# Altium project ELO301_G1.PrjPcb
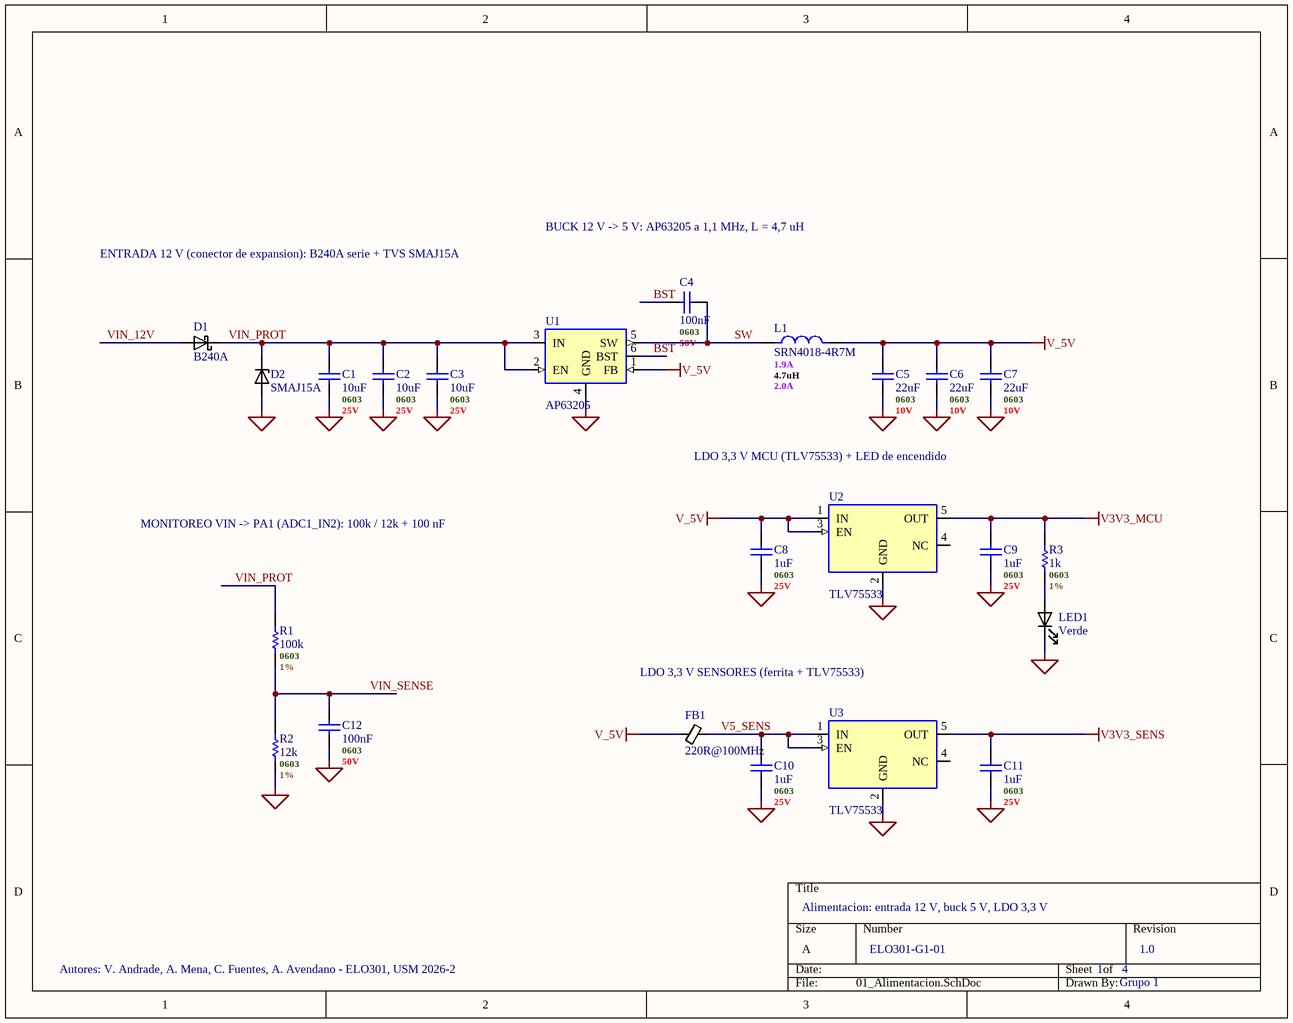
[diagram p0: 01_Alimentacion.SchDoc]
4 sheets, 70 parts. Net scope: global (net labels, ports and power ports of the same name join across sheets).
Board file: ELO301_G1.PcbDoc
Sheets:
  01_Alimentacion.SchDoc
  02_MCU.SchDoc
  03_Sensores.SchDoc
  04_Conectores.SchDoc

## Sheet 01_Alimentacion.SchDoc
size A; SheetNumber: 1; SheetTotal: 4

### Parts
C1  10uF  .Case/Package: 0603  .Voltage Rating (DC): 25V  [C0603 - MURATA]
C2  10uF  .Case/Package: 0603  .Voltage Rating (DC): 25V  [C0603 - MURATA]
C3  10uF  .Case/Package: 0603  .Voltage Rating (DC): 25V  [C0603 - MURATA]
C4  100nF  .Case/Package: 0603  .Voltage Rating (DC): 50V  [C0603 - MURATA]
C5  22uF  .Case/Package: 0603  .Voltage Rating (DC): 10V  [C0603 - MURATA]
C6  22uF  .Case/Package: 0603  .Voltage Rating (DC): 10V  [C0603 - MURATA]
C7  22uF  .Case/Package: 0603  .Voltage Rating (DC): 10V  [C0603 - MURATA]
C8  1uF  .Case/Package: 0603  .Voltage Rating (DC): 25V  [C0603 - MURATA]
C9  1uF  .Case/Package: 0603  .Voltage Rating (DC): 25V  [C0603 - MURATA]
C10  1uF  .Case/Package: 0603  .Voltage Rating (DC): 25V  [C0603 - MURATA]
C11  1uF  .Case/Package: 0603  .Voltage Rating (DC): 25V  [C0603 - MURATA]
C12  100nF  .Case/Package: 0603  .Voltage Rating (DC): 50V  [C0603 - MURATA]
D1  B240A  [SMA - DIODES]
D2  SMAJ15A  [SMA - DIODES]
FB1  220R@100MHz  [L0603 - GENERIC]
L1  SRN4018-4R7M  .RMS Current (Irms): 1.9A  .Value: 4.7uH  .Max DC Current: 2.0A  [SRN4018 - BOURNS]
LED1  Verde  [LED0603 - LITEON]
R1  100k  .Case/Package: 0603  .Tolerance: 1%  [R0603 - YAGEO]
R2  12k  .Case/Package: 0603  .Tolerance: 1%  [R0603 - YAGEO]
R3  1k  .Case/Package: 0603  .Tolerance: 1%  [R0603 - YAGEO]
U1  AP63205  [TSOT-23-6 - DIODES]
U2  TLV75533  [SOT-23-5 - TI]
U3  TLV75533  [SOT-23-5 - TI]

### Nets
GND: C1.2 C2.2 C3.2 C5.2 C6.2 C7.2 C8.2 C9.2 C10.2 C11.2 C12.2 D2.2(A) LED1.1(K) R2.1 U1.4(GND) U2.2(GND) U3.2(GND)
V3V3_MCU: C9.1 R3.2 U2.5(OUT)
V3V3_SENS: C11.1 U3.5(OUT)
V_5V: C5.1 C6.1 C7.1 C8.1 FB1.1 L1.2 U1.1(FB) U2.1(IN) U2.3(EN)
BST: C4.1 U1.6(BST)
SW: C4.2 L1.1 U1.5(SW)
V5_SENS: C10.1 FB1.2 U3.1(IN) U3.3(EN)
VIN_12V: D1.2(A)
VIN_PROT: C1.1 C2.1 C3.1 D1.1(K) D2.1(K) R1.2 U1.2(EN) U1.3(IN)
VIN_SENSE: C12.1 R1.1 R2.2
NetLED1_2: LED1.2(A) R3.1

Not connected (* = marked no-connect by the designer): U2 4(NC); U3 4(NC)

### Notes on the sheet
- BUCK 12 V -> 5 V: AP63205 a 1,1 MHz, L = 4,7 uH
- ENTRADA 12 V (conector de expansion): B240A serie + TVS SMAJ15A
- LDO 3,3 V MCU (TLV75533) + LED de encendido
- MONITOREO VIN -> PA1 (ADC1_IN2): 100k / 12k + 100 nF
- LDO 3,3 V SENSORES (ferrita + TLV75533)
- Alimentacion: entrada 12 V, buck 5 V, LDO 3,3 V
- Autores: V. Andrade, A. Mena, C. Fuentes, A. Avendano - ELO301, USM 2026-2
- ELO301-G1-01
- 1
- 4
- 1.0
- Grupo 1

### Library data of the parts
C1-C3 = CAP - GENERIC: 10 µF ±20% 25V Ceramic Capacitor X5R 0603 (1608 Metric); Manufacturer: Murata Electronics; Manufacturer Part Number: GRM188R61E106MA73D; Case/Package: 0603; Voltage Rating (DC): 25V; Supplier 1: DigiKey; Supplier Part Number 1: 490-7202-1-ND; Supplier 2: LCSC; Supplier Part Number 2: C91606; Category: Ceramic Capacitors; Operating Temperature: -55°C ~ 85°C; Lifecycle Status: Active; ComponentLink1Description: Datasheet; ComponentLink1URL: https://mm.digikey.com/Volume0/opasdata/d220001/medias/docus/8942/Chip_Multilayer_CAT2021_MLCC.pdf; ComponentLink2Description: DigiKey; ComponentLink2URL: https://www.digikey.com/en/products/result?keywords=GRM188R61E106MA73D
C4 C12 = CAP - GENERIC: 0.1 µF ±10% 50V Ceramic Capacitor X7R 0603 (1608 Metric); Manufacturer: Murata Electronics; Manufacturer Part Number: GCM188R71H104KA57D; Case/Package: 0603; Voltage Rating (DC): 50V; Supplier 1: DigiKey; Supplier Part Number 1: 490-4779-1-ND; Category: Ceramic Capacitors; Operating Temperature: -55°C ~ 125°C; Lifecycle Status: Active; ComponentLink1Description: Datasheet; ComponentLink1URL: https://pim.murata.com/asset/pim4/ceramicCapacitorSMD/GCM188R71H104KA57-01A-EN_PDF_CERAMICCAPACITORSMD; ComponentLink2Description: DigiKey; ComponentLink2URL: https://www.digikey.com/en/products/result?keywords=GCM188R71H104KA57D
C5-C7 = CAP - GENERIC: 22 µF ±20% 10V Ceramic Capacitor X5R 0603 (1608 Metric); Manufacturer: Murata Electronics; Manufacturer Part Number: GRM188R61A226ME15D; Case/Package: 0603; Voltage Rating (DC): 10V; Supplier 1: DigiKey; Supplier Part Number 1: 490-10476-1-ND; Supplier 2: LCSC; Supplier Part Number 2: C84419; Category: Ceramic Capacitors; Operating Temperature: -55°C ~ 85°C; Lifecycle Status: Active; ComponentLink1Description: Datasheet; ComponentLink1URL: https://mm.digikey.com/Volume0/opasdata/d220001/medias/docus/8942/490_Chip_Multilayer_CAT2021_MLCC.pdf; ComponentLink2Description: DigiKey; ComponentLink2URL: https://www.digikey.com/en/products/result?keywords=GRM188R61A226ME15D
C8-C11 = CAP - GENERIC: 1 µF ±10% 25V Ceramic Capacitor X7R 0603 (1608 Metric); Manufacturer: Murata Electronics; Manufacturer Part Number: GCM188R71E105KA64D; Case/Package: 0603; Voltage Rating (DC): 25V; Supplier 1: DigiKey; Supplier Part Number 1: 490-10673-1-ND; Category: Ceramic Capacitors; Operating Temperature: -55°C ~ 125°C; Lifecycle Status: Active; ComponentLink1Description: Datasheet; ComponentLink1URL: https://pim.murata.com/asset/pim4/ceramicCapacitorSMD/GCM188R71E105KA64-04A-EN_PDF_CERAMICCAPACITORSMD; ComponentLink2Description: DigiKey; ComponentLink2URL: https://www.digikey.com/en/products/result?keywords=GCM188R71E105KA64D
D1 = B240A-13-F: Schottky Diode 40 V 2A Surface Mount SMA; Manufacturer: Diodes Incorporated; Manufacturer Part Number: B240A-13-F; Supplier 1: DigiKey; Supplier Part Number 1: B240A-FDICT-ND; Supplier 2: LCSC; Supplier Part Number 2: C92506; Category: Single Diodes; Case/Package: DO-214AC, SMA; Supplier Device Package: SMA; Operating Temperature: -65°C ~ 150°C; Lifecycle Status: Active; ComponentLink1Description: Datasheet; ComponentLink1URL: https://www.diodes.com/assets/Datasheets/B220_A-B260_A.pdf; ComponentLink2Description: DigiKey; ComponentLink2URL: https://www.digikey.com/en/products/result?keywords=B240A-13-F
D2 = SMAJ15A-13-F: 24.4V Clamp 16.4A Ipp Tvs Diode Surface Mount SMA; Manufacturer: Diodes Incorporated; Manufacturer Part Number: SMAJ15A-13-F; Supplier 1: DigiKey; Supplier Part Number 1: SMAJ15A-FDICT-ND; Supplier 2: LCSC; Supplier Part Number 2: C110520; Category: TVS Diodes; Case/Package: DO-214AC, SMA; Supplier Device Package: SMA; Operating Temperature: -55°C ~ 150°C (TJ); Lifecycle Status: Active; ComponentLink1Description: Datasheet; ComponentLink1URL: https://www.diodes.com/assets/Datasheets/SMAJ5.0CA-SMAJ200CA.pdf; ComponentLink2Description: DigiKey; ComponentLink2URL: https://www.digikey.com/en/products/result?keywords=SMAJ15A-13-F
FB1 = FERRITE - GENERIC: 220 Ohms @ 100 MHz 1 Power Line Ferrite Bead 0603 (1608 Metric) 1.4A 100mOhm; Manufacturer: Murata Electronics; Manufacturer Part Number: BLM18PG221SN1D; Supplier 1: DigiKey; Supplier Part Number 1: 490-5221-1-ND; Supplier 2: LCSC; Supplier Part Number 2: C80165; Category: Ferrite Beads and Chips; Case/Package: 0603 (1608 Metric); Operating Temperature: -55°C ~ 125°C; Lifecycle Status: Active; ComponentLink1Description: Datasheet; ComponentLink1URL: https://pim.murata.com/asset/pim4/ferriteBeadInductortypefilter/ENFA0003_PDF_FERRITEBEADINDUCTORTYPEFILTER; ComponentLink2Description: DigiKey; ComponentLink2URL: https://www.digikey.com/en/products/result?keywords=BLM18PG221SN1D
L1 = INDUCTOR - GENERIC: 4.7 µH Shielded Drum Core, Wirewound Inductor 1.9 A 84mOhm Max Nonstandard; Manufacturer: Bourns Inc.; Value: 4.7uH; Manufacturer Part Number: SRN4018-4R7M; RMS Current (Irms): 1.9A; Max DC Current: 2.0A; Supplier 1: DigiKey; Supplier Part Number 1: SRN4018-4R7MCT-ND; Supplier 2: LCSC; Supplier Part Number 2: C780206; Category: Fixed Inductors; Operating Temperature: -40°C ~ 125°C; Lifecycle Status: Active; ComponentLink1Description: Datasheet; ComponentLink1URL: https://www.bourns.com/docs/Product-Datasheets/SRN4018.pdf; ComponentLink2Description: DigiKey; ComponentLink2URL: https://www.digikey.com/en/products/result?keywords=SRN4018-4R7M
LED1 = LED - GENERIC: Green 571nm LED Indication - Discrete 2V 0603 (1608 Metric); Manufacturer: Lite-On Inc.; Manufacturer Part Number: LTST-C191KGKT; Supplier 1: DigiKey; Supplier Part Number 1: 160-1446-1-ND; Supplier 2: LCSC; Supplier Part Number 2: C125098; Category: LED Indication - Discrete; Case/Package: 0603 (1608 Metric); Lifecycle Status: Active; ComponentLink1Description: Datasheet; ComponentLink1URL: https://optoelectronics.liteon.com/upload/download/DS22-2000-228/LTST-C191KGKT.PDF; ComponentLink2Description: DigiKey; ComponentLink2URL: https://www.digikey.com/en/products/result?keywords=LTST-C191KGKT
R1 = RESISTOR - GENERIC: 100 kOhms ±1% 0.1W, 1/10W Chip Resistor 0603 (1608 Metric) Moisture Resistant Thick Film; Manufacturer: YAGEO; Manufacturer Part Number: RC0603FR-07100KL; Case/Package: 0603; Tolerance: 1%; Supplier 1: DigiKey; Supplier Part Number 1: 311-100KHRCT-ND; Supplier 2: LCSC; Supplier Part Number 2: C14675; Category: Chip Resistor - Surface Mount; Operating Temperature: -55°C ~ 155°C; Lifecycle Status: Active; ComponentLink1Description: Datasheet; ComponentLink1URL: https://yageogroup.com/content/datasheet/asset/file/PYU-RC_GROUP_51_ROHS_L; ComponentLink2Description: DigiKey; ComponentLink2URL: https://www.digikey.com/en/products/result?keywords=RC0603FR-07100KL
R2 = RESISTOR - GENERIC: 12 kOhms ±1% 0.1W, 1/10W Chip Resistor 0603 (1608 Metric) Moisture Resistant Thick Film; Manufacturer: YAGEO; Manufacturer Part Number: RC0603FR-0712KL; Case/Package: 0603; Tolerance: 1%; Supplier 1: DigiKey; Supplier Part Number 1: 311-12.0KHRCT-ND; Supplier 2: LCSC; Supplier Part Number 2: C114659; Category: Chip Resistor - Surface Mount; Operating Temperature: -55°C ~ 155°C; Lifecycle Status: Active; ComponentLink1Description: Datasheet; ComponentLink1URL: https://yageogroup.com/content/datasheet/asset/file/PYU-RC_GROUP_51_ROHS_L; ComponentLink2Description: DigiKey; ComponentLink2URL: https://www.digikey.com/en/products/result?keywords=RC0603FR-0712KL
R3 = RESISTOR - GENERIC: 1 kOhms ±1% 0.1W, 1/10W Chip Resistor 0603 (1608 Metric) Moisture Resistant Thick Film; Manufacturer: YAGEO; Manufacturer Part Number: RC0603FR-071KL; Case/Package: 0603; Tolerance: 1%; Supplier 1: DigiKey; Supplier Part Number 1: 311-1.00KHRCT-ND; Supplier 2: LCSC; Supplier Part Number 2: C22548; Category: Chip Resistor - Surface Mount; Operating Temperature: -55°C ~ 155°C; Lifecycle Status: Active; ComponentLink1Description: Datasheet; ComponentLink1URL: https://yageogroup.com/content/datasheet/asset/file/PYU-RC_GROUP_51_ROHS_L; ComponentLink2Description: DigiKey; ComponentLink2URL: https://www.digikey.com/en/products/result?keywords=RC0603FR-071KL
U1 = AP63205WU-7: Buck Switching Regulator IC Positive Fixed 5V 1 Output 2A SOT-23-6 Thin, TSOT-23-6; Manufacturer: Diodes Incorporated; Manufacturer Part Number: AP63205WU-7; Supplier 1: DigiKey; Supplier Part Number 1: AP63205WU-7DICT-ND; Supplier 2: LCSC; Supplier Part Number 2: C2071056; Category: Voltage Regulators - DC DC Switching Regulators; Case/Package: SOT-23-6 Thin, TSOT-23-6; Supplier Device Package: TSOT-23-6; Operating Temperature: -40°C ~ 85°C (TA); Lifecycle Status: Active; ComponentLink1Description: Datasheet; ComponentLink1URL: https://www.diodes.com/assets/Datasheets/AP63200-AP63201-AP63203-AP63205.pdf; ComponentLink2Description: DigiKey; ComponentLink2URL: https://www.digikey.com/en/products/result?keywords=AP63205WU-7
U2 U3 = TLV75533PDBVR: Linear Voltage Regulator IC Positive Fixed 1 Output 500mA SOT-23-5; Manufacturer: Texas Instruments; Manufacturer Part Number: TLV75533PDBVR; Supplier 1: DigiKey; Supplier Part Number 1: 296-50411-1-ND; Supplier 2: LCSC; Supplier Part Number 2: C404027; Category: Voltage Regulators - Linear, Low Drop Out (LDO) Regulators; Case/Package: SC-74A, SOT-753; Supplier Device Package: SOT-23-5; Operating Temperature: -40°C ~ 125°C (TJ); Lifecycle Status: Active; ComponentLink1Description: Datasheet; ComponentLink1URL: https://www.ti.com/lit/ds/symlink/tlv755p.pdf; ComponentLink2Description: DigiKey; ComponentLink2URL: https://www.digikey.com/en/products/result?keywords=TLV75533PDBVR

## Sheet 02_MCU.SchDoc
size A; SheetNumber: 2; SheetTotal: 4
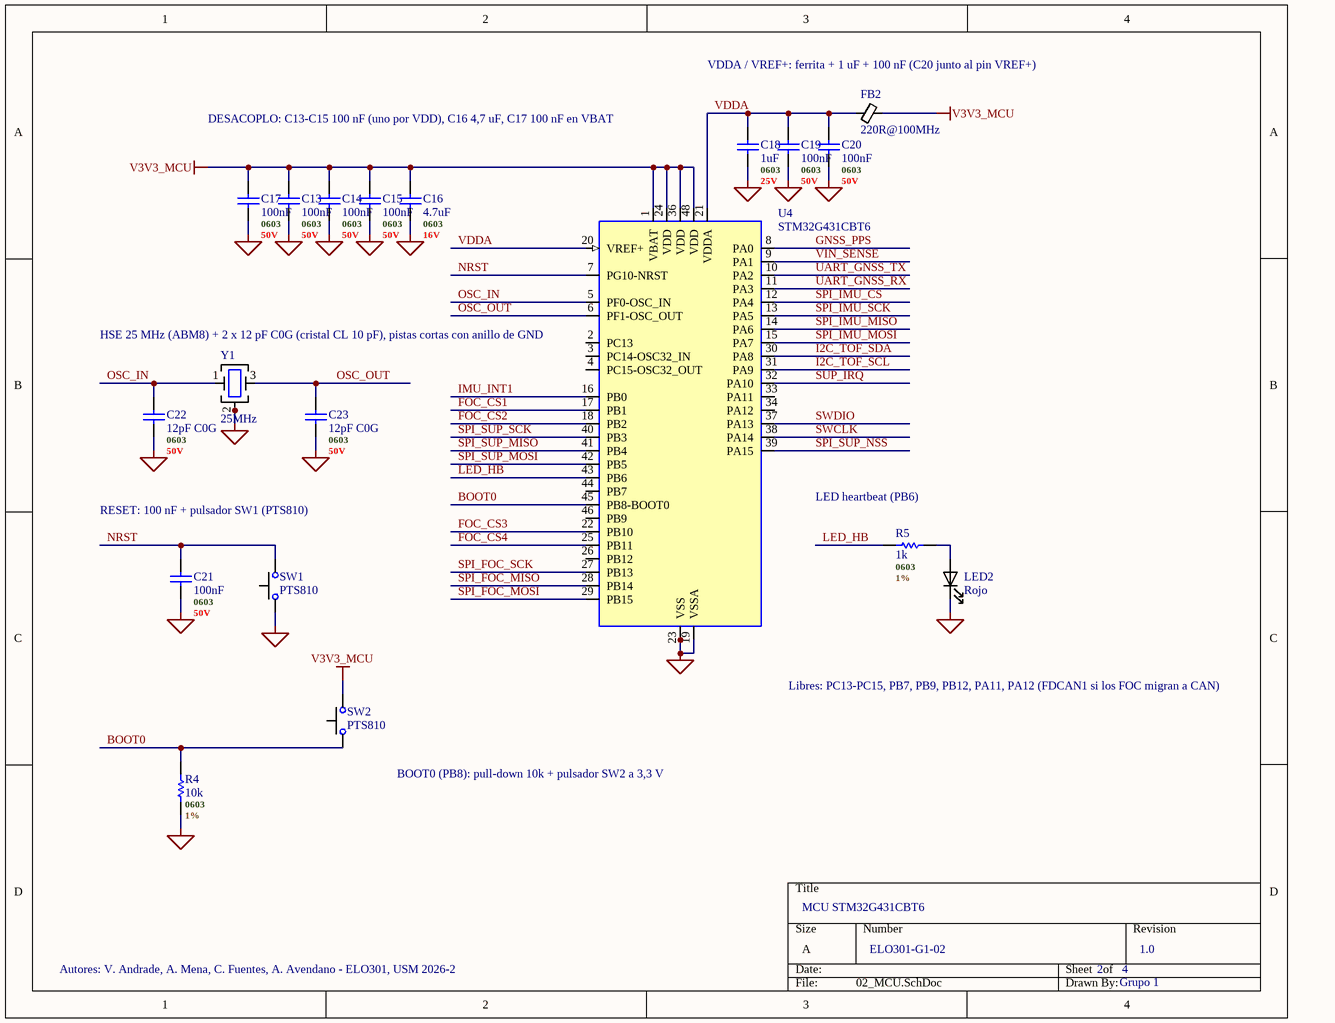
[diagram p1: 02_MCU.SchDoc]

### Parts
C13  100nF  .Case/Package: 0603  .Voltage Rating (DC): 50V  [C0603 - MURATA]
C14  100nF  .Case/Package: 0603  .Voltage Rating (DC): 50V  [C0603 - MURATA]
C15  100nF  .Case/Package: 0603  .Voltage Rating (DC): 50V  [C0603 - MURATA]
C16  4.7uF  .Case/Package: 0603  .Voltage Rating (DC): 16V  [C0603 - MURATA]
C17  100nF  .Case/Package: 0603  .Voltage Rating (DC): 50V  [C0603 - MURATA]
C18  1uF  .Case/Package: 0603  .Voltage Rating (DC): 25V  [C0603 - MURATA]
C19  100nF  .Case/Package: 0603  .Voltage Rating (DC): 50V  [C0603 - MURATA]
C20  100nF  .Case/Package: 0603  .Voltage Rating (DC): 50V  [C0603 - MURATA]
C21  100nF  .Case/Package: 0603  .Voltage Rating (DC): 50V  [C0603 - MURATA]
C22  12pF C0G  .Case/Package: 0603  .Voltage Rating (DC): 50V  [C0603 - MURATA]
C23  12pF C0G  .Case/Package: 0603  .Voltage Rating (DC): 50V  [C0603 - MURATA]
FB2  220R@100MHz  [L0603 - GENERIC]
LED2  Rojo  [LED0603 - LITEON]
R4  10k  .Case/Package: 0603  .Tolerance: 1%  [R0603 - YAGEO]
R5  1k  .Case/Package: 0603  .Tolerance: 1%  [R0603 - YAGEO]
SW1  PTS810  [PTS810 - CK]
SW2  PTS810  [PTS810 - CK]
U4  STM32G431CBT6  [LQFP-48 - ST]
Y1  25MHz  [ABM8 - ABRACON]

### Nets
GND: C13.2 C14.2 C15.2 C16.2 C17.2 C18.2 C19.2 C20.2 C21.2 C22.2 C23.2 LED2.1(K) R4.1 SW1.1 U4.19(VSSA) U4.23(VSS) U4.35(VSS) U4.47(VSS) Y1.2(G) Y1.4(G)
V3V3_MCU: C13.1 C14.1 C15.1 C16.1 C17.1 FB2.2 SW2.2 U4.1(VBAT) U4.24(VDD) U4.36(VDD) U4.48(VDD)
BOOT0: R4.2 SW2.1 U4.45(PB8-BOOT0)
FOC_CS1: U4.17(PB1)
FOC_CS2: U4.18(PB2)
FOC_CS3: U4.22(PB10)
FOC_CS4: U4.25(PB11)
GNSS_PPS: U4.8(PA0)
I2C_TOF_SCL: U4.31(PA9)
I2C_TOF_SDA: U4.30(PA8)
IMU_INT1: U4.16(PB0)
LED_HB: R5.1 U4.43(PB6)
NRST: C21.1 SW1.2 U4.7(PG10-NRST)
OSC_IN: C22.1 U4.5(PF0-OSC_IN) Y1.1
OSC_OUT: C23.1 U4.6(PF1-OSC_OUT) Y1.3
SPI_FOC_MISO: U4.28(PB14)
SPI_FOC_MOSI: U4.29(PB15)
SPI_FOC_SCK: U4.27(PB13)
SPI_IMU_CS: U4.12(PA4)
SPI_IMU_MISO: U4.14(PA6)
SPI_IMU_MOSI: U4.15(PA7)
SPI_IMU_SCK: U4.13(PA5)
SPI_SUP_MISO: U4.41(PB4)
SPI_SUP_MOSI: U4.42(PB5)
SPI_SUP_NSS: U4.39(PA15)
SPI_SUP_SCK: U4.40(PB3)
SUP_IRQ: U4.32(PA10)
SWCLK: U4.38(PA14)
SWDIO: U4.37(PA13)
UART_GNSS_RX: U4.11(PA3)
UART_GNSS_TX: U4.10(PA2)
VDDA: C18.1 C19.1 C20.1 FB2.1 U4.20(VREF+) U4.21(VDDA)
VIN_SENSE: U4.9(PA1)
NetLED2_2: LED2.2(A) R5.2

Not connected (* = marked no-connect by the designer): U4 2(PC13) 3(PC14-OSC32_IN) 4(PC15-OSC32_OUT) 26(PB12) 33(PA11) 34(PA12) 44(PB7) 46(PB9)

### Notes on the sheet
- (near FB2) VDDA / VREF+: ferrita + 1 uF + 100 nF (C20 junto al pin VREF+)
- DESACOPLO: C13-C15 100 nF (uno por VDD), C16 4,7 uF, C17 100 nF en VBAT
- (near U4) HSE 25 MHz (ABM8) + 2 x 12 pF C0G (cristal CL 10 pF), pistas cortas con anillo de GND
- LED heartbeat (PB6)
- RESET: 100 nF + pulsador SW1 (PTS810)
- Libres: PC13-PC15, PB7, PB9, PB12, PA11, PA12 (FDCAN1 si los FOC migran a CAN)
- BOOT0 (PB8): pull-down 10k + pulsador SW2 a 3,3 V
- MCU STM32G431CBT6
- Autores: V. Andrade, A. Mena, C. Fuentes, A. Avendano - ELO301, USM 2026-2
- ELO301-G1-02
- 2
- 4
- 1.0
- Grupo 1

### Library data of the parts
C13-C15 C17 C19-C21 = CAP - GENERIC: as C4 on sheet 01_Alimentacion; Case/Package: 0603; Voltage Rating (DC): 50V; Supplier 1: DigiKey; Supplier Part Number 1: 490-4779-1-ND; Category: Ceramic Capacitors; Operating Temperature: -55°C ~ 125°C; Lifecycle Status: Active; ComponentLink1Description: Datasheet; ComponentLink1URL: https://pim.murata.com/asset/pim4/ceramicCapacitorSMD/GCM188R71H104KA57-01A-EN_PDF_CERAMICCAPACITORSMD; ComponentLink2Description: DigiKey; ComponentLink2URL: https://www.digikey.com/en/products/result?keywords=GCM188R71H104KA57D
C16 = CAP - GENERIC: 4.7 µF ±20% 16V Ceramic Capacitor X5R 0603 (1608 Metric); Manufacturer: Murata Electronics; Manufacturer Part Number: GRM188R61C475ME11J; Case/Package: 0603; Voltage Rating (DC): 16V; Supplier 1: DigiKey; Supplier Part Number 1: 490-GRM188R61C475ME11JCT-ND; Category: Ceramic Capacitors; Operating Temperature: -55°C ~ 85°C; Lifecycle Status: Active; ComponentLink1Description: Datasheet; ComponentLink1URL: https://pim.murata.com/asset/pim4/ceramicCapacitorSMD/GRM188R61C475ME11-01A-EN_PDF_CERAMICCAPACITORSMD; ComponentLink2Description: DigiKey; ComponentLink2URL: https://www.digikey.com/en/products/result?keywords=GRM188R61C475ME11J
C18 = CAP - GENERIC: as C8 on sheet 01_Alimentacion; Case/Package: 0603; Voltage Rating (DC): 25V; Supplier 1: DigiKey; Supplier Part Number 1: 490-10673-1-ND; Category: Ceramic Capacitors; Operating Temperature: -55°C ~ 125°C; Lifecycle Status: Active; ComponentLink1Description: Datasheet; ComponentLink1URL: https://pim.murata.com/asset/pim4/ceramicCapacitorSMD/GCM188R71E105KA64-04A-EN_PDF_CERAMICCAPACITORSMD; ComponentLink2Description: DigiKey; ComponentLink2URL: https://www.digikey.com/en/products/result?keywords=GCM188R71E105KA64D
C22 C23 = CAP - GENERIC: 12 pF ±5% 50V Ceramic Capacitor C0G, NP0 0603 (1608 Metric); Manufacturer: Samsung Electro-Mechanics; Manufacturer Part Number: CL10C120JB8NNNC; Case/Package: 0603; Voltage Rating (DC): 50V; Supplier 1: DigiKey; Supplier Part Number 1: 1276-1254-1-ND; Supplier 2: LCSC; Supplier Part Number 2: C38523; Category: Ceramic Capacitors; Operating Temperature: -55°C ~ 125°C; Lifecycle Status: Active; ComponentLink1Description: Datasheet; ComponentLink1URL: https://mm.digikey.com/Volume0/opasdata/d220001/medias/docus/3682/CL10C120JB8NNNC_Spec.pdf; ComponentLink2Description: DigiKey; ComponentLink2URL: https://www.digikey.com/en/products/result?keywords=CL10C120JB8NNNC
FB2 = FERRITE - GENERIC: as FB1 on sheet 01_Alimentacion; Supplier 1: DigiKey; Supplier Part Number 1: 490-5221-1-ND; Supplier 2: LCSC; Supplier Part Number 2: C80165; Category: Ferrite Beads and Chips; Case/Package: 0603 (1608 Metric); Operating Temperature: -55°C ~ 125°C; Lifecycle Status: Active; ComponentLink1Description: Datasheet; ComponentLink1URL: https://pim.murata.com/asset/pim4/ferriteBeadInductortypefilter/ENFA0003_PDF_FERRITEBEADINDUCTORTYPEFILTER; ComponentLink2Description: DigiKey; ComponentLink2URL: https://www.digikey.com/en/products/result?keywords=BLM18PG221SN1D
LED2 = LED - GENERIC: Red 631nm LED Indication - Discrete 2V 0603 (1608 Metric); Manufacturer: Lite-On Inc.; Manufacturer Part Number: LTST-C191KRKT; Supplier 1: DigiKey; Supplier Part Number 1: 160-1447-1-ND; Supplier 2: LCSC; Supplier Part Number 2: C125099; Category: LED Indication - Discrete; Case/Package: 0603 (1608 Metric); Lifecycle Status: Active; ComponentLink1Description: Datasheet; ComponentLink1URL: https://optoelectronics.liteon.com/upload/download/DS22-2000-223/LTST-C191KRKT.PDF; ComponentLink2Description: DigiKey; ComponentLink2URL: https://www.digikey.com/en/products/result?keywords=LTST-C191KRKT
R4 = RESISTOR - GENERIC: 10 kOhms ±1% 0.1W, 1/10W Chip Resistor 0603 (1608 Metric) Moisture Resistant Thick Film; Manufacturer: YAGEO; Manufacturer Part Number: RC0603FR-0710KL; Case/Package: 0603; Tolerance: 1%; Supplier 1: DigiKey; Supplier Part Number 1: 311-10.0KHRCT-ND; Supplier 2: LCSC; Supplier Part Number 2: C98220; Category: Chip Resistor - Surface Mount; Operating Temperature: -55°C ~ 155°C; Lifecycle Status: Active; ComponentLink1Description: Datasheet; ComponentLink1URL: https://yageogroup.com/content/datasheet/asset/file/PYU-RC_GROUP_51_ROHS_L; ComponentLink2Description: DigiKey; ComponentLink2URL: https://www.digikey.com/en/products/result?keywords=RC0603FR-0710KL
R5 = RESISTOR - GENERIC: as R3 on sheet 01_Alimentacion; Case/Package: 0603; Tolerance: 1%; Supplier 1: DigiKey; Supplier Part Number 1: 311-1.00KHRCT-ND; Supplier 2: LCSC; Supplier Part Number 2: C22548; Category: Chip Resistor - Surface Mount; Operating Temperature: -55°C ~ 155°C; Lifecycle Status: Active; ComponentLink1Description: Datasheet; ComponentLink1URL: https://yageogroup.com/content/datasheet/asset/file/PYU-RC_GROUP_51_ROHS_L; ComponentLink2Description: DigiKey; ComponentLink2URL: https://www.digikey.com/en/products/result?keywords=RC0603FR-071KL
SW1 SW2 = PTS810 SJM 250 SMTR LFS: Tactile Switch SPST-NO Top Actuated Surface Mount; Manufacturer: C&K; Manufacturer Part Number: PTS810 SJM 250 SMTR LFS; Supplier 1: DigiKey; Supplier Part Number 1: CKN10502CT-ND; Supplier 2: LCSC; Supplier Part Number 2: C116501; Category: Tactile Switches; Case/Package: 4.20mm x 3.20mm; Operating Temperature: -40°C ~ 85°C; Lifecycle Status: Active; ComponentLink1Description: Datasheet; ComponentLink1URL: https://www.littelfuse.com/assetdocs/littelfuse-c-k-tactile-pts810-series-datasheet?assetguid=f1e4bc97-66e9-4beb-99c6-eaef0bd3bff4; ComponentLink2Description: DigiKey; ComponentLink2URL: https://www.digikey.com/en/products/result?keywords=PTS810%20SJM%20250%20SMTR%20LFS
U4 = STM32G431CBT6: ARM® Cortex®-M4F STM32G4 Microcontroller IC 32-Bit 170MHz 128KB (128K x 8) FLASH 48-LQFP (7x7); Manufacturer: STMicroelectronics; Manufacturer Part Number: STM32G431CBT6; Supplier 1: DigiKey; Supplier Part Number 1: 497-19473-ND; Supplier 2: LCSC; Supplier Part Number 2: C529355; Category: Microcontrollers; Case/Package: 48-LQFP; Supplier Device Package: 48-LQFP (7x7); Operating Temperature: -40°C ~ 85°C (TA); Lifecycle Status: Active; ComponentLink1Description: Datasheet; ComponentLink1URL: https://www.st.com/resource/en/datasheet/stm32g431cb.pdf; ComponentLink2Description: DigiKey; ComponentLink2URL: https://www.digikey.com/en/products/result?keywords=STM32G431CBT6
Y1 = ABM8-25.000MHZ-10-D1G-T: 25 MHz ±10ppm Crystal 10pF 50 Ohms 4-SMD, No Lead; Manufacturer: Abracon LLC; Manufacturer Part Number: ABM8-25.000MHZ-10-D1G-T; Supplier 1: DigiKey; Supplier Part Number 1: 535-13468-1-ND; Supplier 2: LCSC; Supplier Part Number 2: C5366868; Category: Crystals; Case/Package: 4-SMD, No Lead; Supplier Device Package: 4-SMD (3.2x2.5); Operating Temperature: -40°C ~ 85°C; Lifecycle Status: Active; ComponentLink1Description: Datasheet; ComponentLink1URL: https://mm.digikey.com/Volume0/opasdata/d220001/medias/docus/6536/ABM8_Datasheet.pdf; ComponentLink2Description: DigiKey; ComponentLink2URL: https://www.digikey.com/en/products/result?keywords=ABM8-25.000MHZ-10-D1G-T

## Sheet 03_Sensores.SchDoc
size A; SheetNumber: 3; SheetTotal: 4
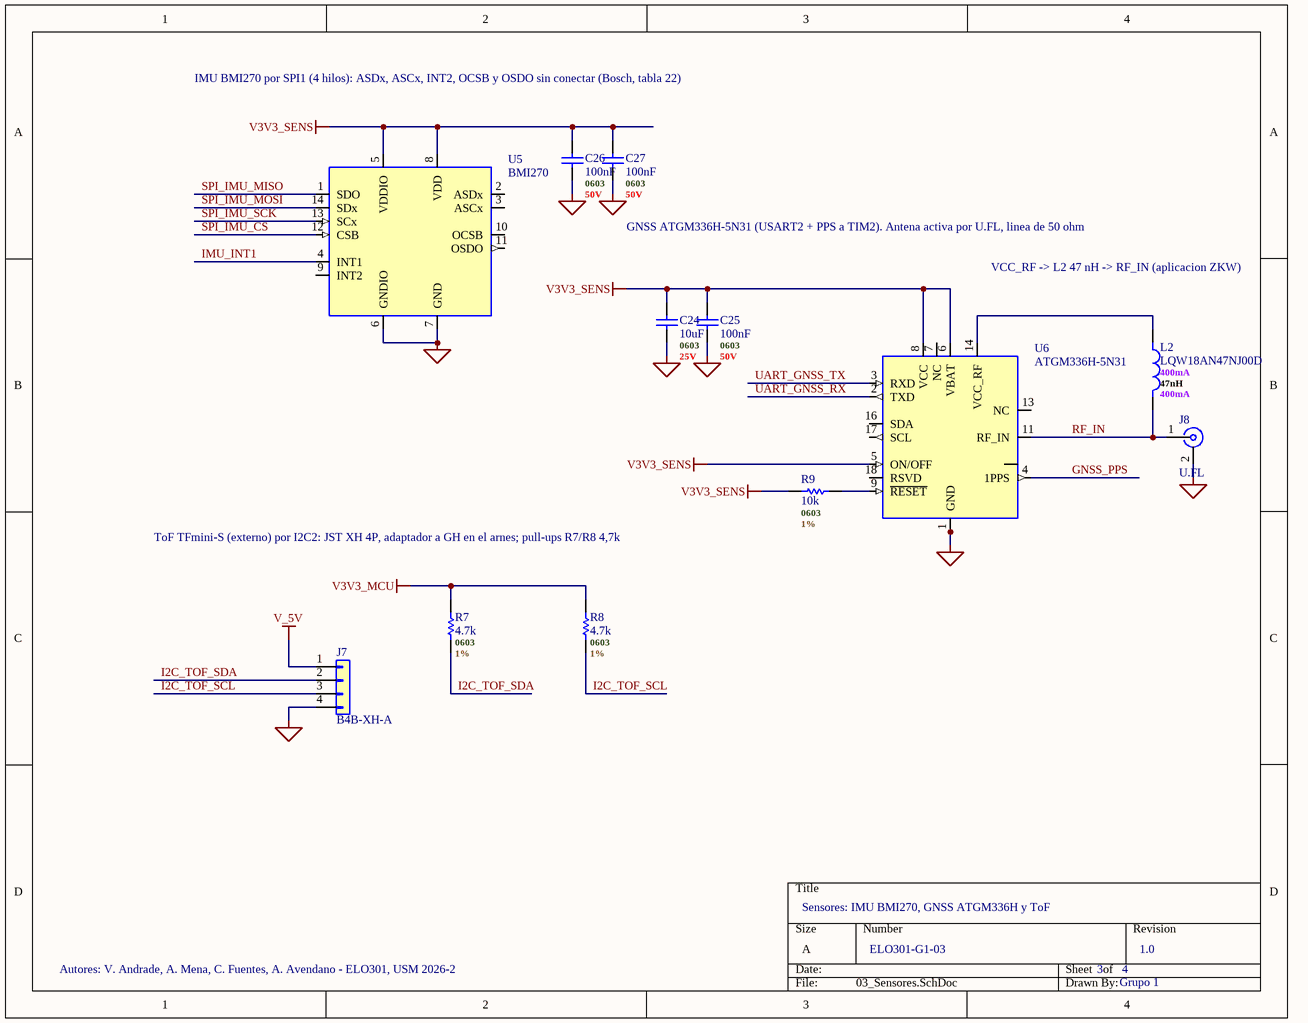
[diagram p2: 03_Sensores.SchDoc]

### Parts
C24  10uF  .Case/Package: 0603  .Voltage Rating (DC): 25V  [C0603 - MURATA]
C25  100nF  .Case/Package: 0603  .Voltage Rating (DC): 50V  [C0603 - MURATA]
C26  100nF  .Case/Package: 0603  .Voltage Rating (DC): 50V  [C0603 - MURATA]
C27  100nF  .Case/Package: 0603  .Voltage Rating (DC): 50V  [C0603 - MURATA]
J7  B4B-XH-A  [B4B-XH-A - JST]
J8  U.FL  [U.FL - HIROSE]
L2  LQW18AN47NJ00D  .RMS Current (Irms): 400mA  .Value: 47nH  [L0603 - GENERIC]
R7  4.7k  .Case/Package: 0603  .Tolerance: 1%  [R0603 - YAGEO]
R8  4.7k  .Case/Package: 0603  .Tolerance: 1%  [R0603 - YAGEO]
R9  10k  .Case/Package: 0603  .Tolerance: 1%  [R0603 - YAGEO]
U5  BMI270  [LGA-14 2.5x3.0 - BOSCH]
U6  ATGM336H-5N31  [LCC-18 9.7x10.1 - ZKW]

### Nets
GND: C24.2 C25.2 C26.2 C27.2 J7.4(Pin_4) J8.2(Ext) U5.6(GNDIO) U5.7(GND) U6.1(GND) U6.10(GND) U6.12(GND)
V3V3_MCU: R7.2 R8.2
V3V3_SENS: C24.1 C25.1 C26.1 C27.1 R9.1 U5.5(VDDIO) U5.8(VDD) U6.5(ON/OFF) U6.6(VBAT) U6.8(VCC)
V_5V: J7.1(Pin_1)
GNSS_PPS: U6.4(1PPS)
I2C_TOF_SCL: J7.3(Pin_3) R8.1
I2C_TOF_SDA: J7.2(Pin_2) R7.1
IMU_INT1: U5.4(INT1)
RF_IN: J8.1(In) L2.2 U6.11(RF_IN)
SPI_IMU_CS: U5.12(CSB)
SPI_IMU_MISO: U5.1(SDO)
SPI_IMU_MOSI: U5.14(SDx)
SPI_IMU_SCK: U5.13(SCx)
UART_GNSS_RX: U6.2(TXD)
UART_GNSS_TX: U6.3(RXD)
NetL2_1: L2.1 U6.14(VCC_RF)
NetR9_2: R9.2 U6.9(~{RESET})

Not connected (* = marked no-connect by the designer): U5 2(ASDx) 3(ASCx) 9(INT2) 10(OCSB) 11(OSDO); U6 7(NC) 13(NC) 15(RSVD) 16(SDA) 17(SCL) 18(RSVD)

### Notes on the sheet
- IMU BMI270 por SPI1 (4 hilos): ASDx, ASCx, INT2, OCSB y OSDO sin conectar (Bosch, tabla 22)
- GNSS ATGM336H-5N31 (USART2 + PPS a TIM2). Antena activa por U.FL, linea de 50 ohm
- VCC_RF -> L2 47 nH -> RF_IN (aplicacion ZKW)
- ToF TFmini-S (externo) por I2C2: JST XH 4P, adaptador a GH en el arnes; pull-ups R7/R8 4,7k
- Sensores: IMU BMI270, GNSS ATGM336H y ToF
- Autores: V. Andrade, A. Mena, C. Fuentes, A. Avendano - ELO301, USM 2026-2
- ELO301-G1-03
- 3
- 4
- 1.0
- Grupo 1

### Library data of the parts
C24 = CAP - GENERIC: as C1 on sheet 01_Alimentacion; Case/Package: 0603; Voltage Rating (DC): 25V; Supplier 1: DigiKey; Supplier Part Number 1: 490-7202-1-ND; Supplier 2: LCSC; Supplier Part Number 2: C91606; Category: Ceramic Capacitors; Operating Temperature: -55°C ~ 85°C; Lifecycle Status: Active; ComponentLink1Description: Datasheet; ComponentLink1URL: https://mm.digikey.com/Volume0/opasdata/d220001/medias/docus/8942/Chip_Multilayer_CAT2021_MLCC.pdf; ComponentLink2Description: DigiKey; ComponentLink2URL: https://www.digikey.com/en/products/result?keywords=GRM188R61E106MA73D
C25-C27 = CAP - GENERIC: as C4 on sheet 01_Alimentacion; Case/Package: 0603; Voltage Rating (DC): 50V; Supplier 1: DigiKey; Supplier Part Number 1: 490-4779-1-ND; Category: Ceramic Capacitors; Operating Temperature: -55°C ~ 125°C; Lifecycle Status: Active; ComponentLink1Description: Datasheet; ComponentLink1URL: https://pim.murata.com/asset/pim4/ceramicCapacitorSMD/GCM188R71H104KA57-01A-EN_PDF_CERAMICCAPACITORSMD; ComponentLink2Description: DigiKey; ComponentLink2URL: https://www.digikey.com/en/products/result?keywords=GCM188R71H104KA57D
J7 = B4B-XH-A(LF)(SN): Connector Header Through Hole 4 position 0.098" (2.50mm); Manufacturer: JST Sales America Inc.; Manufacturer Part Number: B4B-XH-A(LF)(SN); Supplier 1: DigiKey; Supplier Part Number 1: 455-B4B-XH-A-ND; Supplier 2: LCSC; Supplier Part Number 2: C144395; Category: Headers, Male Pins; Case/Package: Through Hole; Operating Temperature: -25°C ~ 85°C; Lifecycle Status: Active; ComponentLink1Description: Datasheet; ComponentLink1URL: https://www.jst-mfg.com/product/pdf/eng/eXH.pdf; ComponentLink2Description: DigiKey; ComponentLink2URL: https://www.digikey.com/en/products/result?keywords=B4B-XH-A
J8 = U.FL-R-SMT-1(10): U.FL (UMCC) Connector Receptacle, Male Pin 50 Ohms Surface Mount Solder; Manufacturer: Hirose Electric Co Ltd; Manufacturer Part Number: U.FL-R-SMT-1(10); Supplier 1: DigiKey; Supplier Part Number 1: H11891CT-ND; Supplier 2: LCSC; Supplier Part Number 2: C88373; Category: Coaxial Connectors (RF); Case/Package: Surface Mount; Operating Temperature: -40°C ~ 90°C; Lifecycle Status: Active; ComponentLink1Description: Datasheet; ComponentLink1URL: https://mm.digikey.com/Volume0/opasdata/d220001/medias/docus/8942/HIROS08829-1.pdf; ComponentLink2Description: DigiKey; ComponentLink2URL: https://www.digikey.com/en/products/result?keywords=U.FL-R-SMT-1(10)
L2 = INDUCTOR - GENERIC: 47 nH Unshielded Drum Core, Wirewound Inductor 380 mA 290mOhm Max 0603 (1608 Metric); Manufacturer: Murata Electronics; Value: 47nH; .Max DC Current: 400mA; Manufacturer Part Number: LQW18AN47NJ00D; RMS Current (Irms): 400mA; Max DC Current: 400mA; Supplier 1: DigiKey; Supplier Part Number 1: 490-6895-1-ND; Supplier 2: LCSC; Supplier Part Number 2: C98077; Category: Fixed Inductors; Operating Temperature: -55°C ~ 125°C; Lifecycle Status: Active; ComponentLink1Description: Datasheet; ComponentLink1URL: https://pim.murata.com/asset/pim4/inductor/JELF243A-0024_PDF_INDUCTOR; ComponentLink2Description: DigiKey; ComponentLink2URL: https://www.digikey.com/en/products/result?keywords=LQW18AN47NJ00D
R7 R8 = RESISTOR - GENERIC: 4.7 kOhms ±1% 0.1W, 1/10W Chip Resistor 0603 (1608 Metric) Moisture Resistant Thick Film; Manufacturer: YAGEO; Manufacturer Part Number: RC0603FR-074K7L; Case/Package: 0603; Tolerance: 1%; Supplier 1: DigiKey; Supplier Part Number 1: 311-4.70KHRCT-ND; Supplier 2: LCSC; Supplier Part Number 2: C99782; Category: Chip Resistor - Surface Mount; Operating Temperature: -55°C ~ 155°C; Lifecycle Status: Active; ComponentLink1Description: Datasheet; ComponentLink1URL: https://yageogroup.com/content/datasheet/asset/file/PYU-RC_GROUP_51_ROHS_L; ComponentLink2Description: DigiKey; ComponentLink2URL: https://www.digikey.com/en/products/result?keywords=RC0603FR-074K7L
R9 = RESISTOR - GENERIC: as R4 on sheet 02_MCU; Case/Package: 0603; Tolerance: 1%; Supplier 1: DigiKey; Supplier Part Number 1: 311-10.0KHRCT-ND; Supplier 2: LCSC; Supplier Part Number 2: C98220; Category: Chip Resistor - Surface Mount; Operating Temperature: -55°C ~ 155°C; Lifecycle Status: Active; ComponentLink1Description: Datasheet; ComponentLink1URL: https://yageogroup.com/content/datasheet/asset/file/PYU-RC_GROUP_51_ROHS_L; ComponentLink2Description: DigiKey; ComponentLink2URL: https://www.digikey.com/en/products/result?keywords=RC0603FR-0710KL
U5 = BMI270: Accelerometer, Gyroscope, 6 Axis Sensor I2C, SPI Output; Manufacturer: Bosch Sensortec; Manufacturer Part Number: BMI270; Supplier 1: DigiKey; Supplier Part Number 1: 828-1091-1-ND; Supplier 2: LCSC; Supplier Part Number 2: C2836813; Category: IMUs (Inertial Measurement Units); Case/Package: 14-VFLGA; Supplier Device Package: 14-LGA (2.5x3); Operating Temperature: -40°C ~ 85°C; Lifecycle Status: Active; ComponentLink1Description: Datasheet; ComponentLink1URL: https://www.bosch-sensortec.com/media/boschsensortec/downloads/datasheets/bst-bmi270-ds000.pdf; ComponentLink2Description: DigiKey; ComponentLink2URL: https://www.digikey.com/en/products/result?keywords=BMI270
U6 = ATGM336H-5N31: BDS/GNSS All-constellation Positioning and Navigation Module; Manufacturer: ZHONGKEWEI; Manufacturer Part Number: ATGM336H-5N31; Supplier 1: LCSC; Supplier Part Number 1: C90770; Category: RF Receivers; Case/Package: SMD, 10.1x9.7mm; Operating Temperature: -40°C ~ 85°C; Lifecycle Status: Active; ComponentLink1Description: Datasheet; ComponentLink1URL: https://www.lcsc.com/datasheet/C90770.pdf; ComponentLink2Description: LCSC; ComponentLink2URL: https://www.lcsc.com/product-detail/C90770.html; Nota DigiKey: No disponible en DigiKey: excepcion documentada (como el U.FL en el documento de diseno)

## Sheet 04_Conectores.SchDoc
size A; SheetNumber: 4; SheetTotal: 4
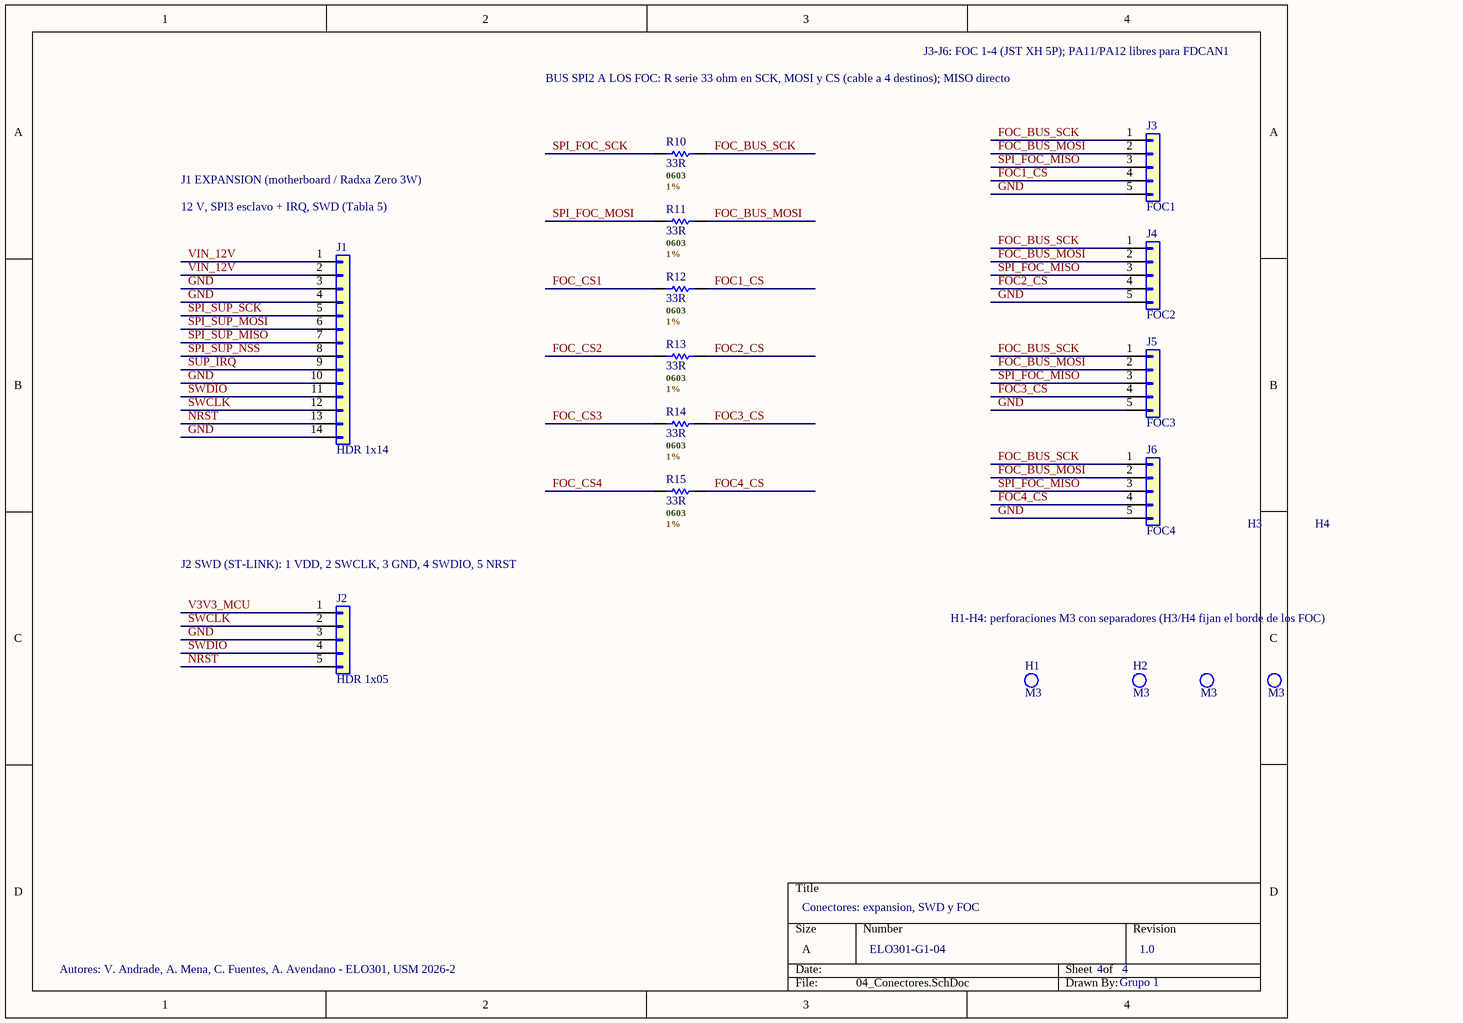
[diagram p3: 04_Conectores.SchDoc]

### Parts
H1  M3  [M3 - HOLE]
H2  M3  [M3 - HOLE]
H3  M3  [M3 - HOLE]
H4  M3  [M3 - HOLE]
J1  HDR 1x14  [HDR 1x14 2.54 - BOOMELE]
J2  HDR 1x05  [HDR 1x05 2.54 - BOOMELE]
J3  FOC1  [B5B-XH-A - JST]
J4  FOC2  [B5B-XH-A - JST]
J5  FOC3  [B5B-XH-A - JST]
J6  FOC4  [B5B-XH-A - JST]
R10  33R  .Case/Package: 0603  .Tolerance: 1%  [R0603 - YAGEO]
R11  33R  .Case/Package: 0603  .Tolerance: 1%  [R0603 - YAGEO]
R12  33R  .Case/Package: 0603  .Tolerance: 1%  [R0603 - YAGEO]
R13  33R  .Case/Package: 0603  .Tolerance: 1%  [R0603 - YAGEO]
R14  33R  .Case/Package: 0603  .Tolerance: 1%  [R0603 - YAGEO]
R15  33R  .Case/Package: 0603  .Tolerance: 1%  [R0603 - YAGEO]

### Nets
GND: J1.3(Pin_3) J1.4(Pin_4) J1.10(Pin_10) J1.14(Pin_14) J2.3(Pin_3) J3.5(Pin_5) J4.5(Pin_5) J5.5(Pin_5) J6.5(Pin_5)
V3V3_MCU: J2.1(Pin_1)
FOC1_CS: J3.4(Pin_4) R12.2
FOC2_CS: J4.4(Pin_4) R13.2
FOC3_CS: J5.4(Pin_4) R14.2
FOC4_CS: J6.4(Pin_4) R15.2
FOC_BUS_MOSI: J3.2(Pin_2) J4.2(Pin_2) J5.2(Pin_2) J6.2(Pin_2) R11.2
FOC_BUS_SCK: J3.1(Pin_1) J4.1(Pin_1) J5.1(Pin_1) J6.1(Pin_1) R10.2
FOC_CS1: R12.1
FOC_CS2: R13.1
FOC_CS3: R14.1
FOC_CS4: R15.1
NRST: J1.13(Pin_13) J2.5(Pin_5)
SPI_FOC_MISO: J3.3(Pin_3) J4.3(Pin_3) J5.3(Pin_3) J6.3(Pin_3)
SPI_FOC_MOSI: R11.1
SPI_FOC_SCK: R10.1
SPI_SUP_MISO: J1.7(Pin_7)
SPI_SUP_MOSI: J1.6(Pin_6)
SPI_SUP_NSS: J1.8(Pin_8)
SPI_SUP_SCK: J1.5(Pin_5)
SUP_IRQ: J1.9(Pin_9)
SWCLK: J1.12(Pin_12) J2.2(Pin_2)
SWDIO: J1.11(Pin_11) J2.4(Pin_4)
VIN_12V: J1.1(Pin_1) J1.2(Pin_2)

### Notes on the sheet
- BUS SPI2 A LOS FOC: R serie 33 ohm en SCK, MOSI y CS (cable a 4 destinos); MISO directo
- J3-J6: FOC 1-4 (JST XH 5P); PA11/PA12 libres para FDCAN1
- J1 EXPANSION (motherboard / Radxa Zero 3W)
- (near J1) 12 V, SPI3 esclavo + IRQ, SWD (Tabla 5)
- (near J2) J2 SWD (ST-LINK): 1 VDD, 2 SWCLK, 3 GND, 4 SWDIO, 5 NRST
- H1-H4: perforaciones M3 con separadores (H3/H4 fijan el borde de los FOC)
- Conectores: expansion, SWD y FOC
- Autores: V. Andrade, A. Mena, C. Fuentes, A. Avendano - ELO301, USM 2026-2
- ELO301-G1-04
- 4
- 1.0
- Grupo 1

### Library data of the parts
H1-H4 = MOUNTING HOLE - M3: Mounting Hole without connection, M3
  H1 H2: Manufacturer: -; Manufacturer Part Number: M3
J1 = BOOMELE 2.54-1x14: CONN HEADER 40POS 2.54mm SINGLE ROW TH (tira 1x40 cortada a 1x14); Manufacturer: BOOMELE(Boom Precision Elec); Manufacturer Part Number: 2.54-1*40P; Supplier 1: LCSC; Supplier Part Number 1: C2337; Category: Headers, Male Pins; Case/Package: Through Hole, P=2.54mm; Operating Temperature: -55°C ~ 105°C; Lifecycle Status: Active; ComponentLink1Description: Datasheet; ComponentLink1URL: https://www.lcsc.com/datasheet/C2337.pdf; ComponentLink2Description: LCSC; ComponentLink2URL: https://www.lcsc.com/product-detail/C2337.html; Nota DigiKey: No disponible en DigiKey: estandar del ramo (tira BOOMELE)
J2 = BOOMELE 2.54-1x05: CONN HEADER 40POS 2.54mm SINGLE ROW TH (tira 1x40 cortada a 1x5); Manufacturer: BOOMELE(Boom Precision Elec); Manufacturer Part Number: 2.54-1*40P; Supplier 1: LCSC; Supplier Part Number 1: C2337; Category: Headers, Male Pins; Case/Package: Through Hole, P=2.54mm; Operating Temperature: -55°C ~ 105°C; Lifecycle Status: Active; ComponentLink1Description: Datasheet; ComponentLink1URL: https://www.lcsc.com/datasheet/C2337.pdf; ComponentLink2Description: LCSC; ComponentLink2URL: https://www.lcsc.com/product-detail/C2337.html; Nota DigiKey: No disponible en DigiKey: estandar del ramo (tira BOOMELE)
J3-J6 = B5B-XH-A(LF)(SN): Connector Header Through Hole 5 position 0.098" (2.50mm); Manufacturer: JST Sales America Inc.; Manufacturer Part Number: B5B-XH-A(LF)(SN); Supplier 1: DigiKey; Supplier Part Number 1: 455-B5B-XH-A-ND; Supplier 2: LCSC; Supplier Part Number 2: C157991; Category: Headers, Male Pins; Case/Package: Through Hole; Operating Temperature: -25°C ~ 85°C; Lifecycle Status: Active; ComponentLink1Description: Datasheet; ComponentLink1URL: https://www.jst-mfg.com/product/pdf/eng/eXH.pdf; ComponentLink2Description: DigiKey; ComponentLink2URL: https://www.digikey.com/en/products/result?keywords=B5B-XH-A
R10-R15 = RESISTOR - GENERIC: 33 Ohms ±1% 0.1W, 1/10W Chip Resistor 0603 (1608 Metric) Moisture Resistant Thick Film; Manufacturer: YAGEO; Manufacturer Part Number: RC0603FR-0733RL; Case/Package: 0603; Tolerance: 1%; Supplier 1: DigiKey; Supplier Part Number 1: 13-RC0603FR-0733RLCT-ND; Supplier 2: LCSC; Supplier Part Number 2: C108661; Category: Chip Resistor - Surface Mount; Operating Temperature: -55°C ~ 155°C; Lifecycle Status: Active; ComponentLink1Description: Datasheet; ComponentLink1URL: https://yageogroup.com/content/datasheet/asset/file/PYU-RC_GROUP_51_ROHS_L; ComponentLink2Description: DigiKey; ComponentLink2URL: https://www.digikey.com/en/products/result?keywords=RC0603FR-0733RL

## Nets that join several sheets
GND: 01_Alimentacion (17 pins), 02_MCU (20 pins), 03_Sensores (11 pins), 04_Conectores (9 pins)
V3V3_MCU: 01_Alimentacion (C9.1 R3.2 U2.5), 02_MCU (11 pins), 03_Sensores (R7.2 R8.2), 04_Conectores (J2.1)
V3V3_SENS: 01_Alimentacion (C11.1 U3.5), 03_Sensores (10 pins)
V_5V: 01_Alimentacion (9 pins), 03_Sensores (J7.1)
FOC_CS1: 02_MCU (U4.17), 04_Conectores (R12.1)
FOC_CS2: 02_MCU (U4.18), 04_Conectores (R13.1)
FOC_CS3: 02_MCU (U4.22), 04_Conectores (R14.1)
FOC_CS4: 02_MCU (U4.25), 04_Conectores (R15.1)
GNSS_PPS: 02_MCU (U4.8), 03_Sensores (U6.4)
I2C_TOF_SCL: 02_MCU (U4.31), 03_Sensores (J7.3 R8.1)
I2C_TOF_SDA: 02_MCU (U4.30), 03_Sensores (J7.2 R7.1)
IMU_INT1: 02_MCU (U4.16), 03_Sensores (U5.4)
NRST: 02_MCU (C21.1 SW1.2 U4.7), 04_Conectores (J1.13 J2.5)
SPI_FOC_MISO: 02_MCU (U4.28), 04_Conectores (J3.3 J4.3 J5.3 J6.3)
SPI_FOC_MOSI: 02_MCU (U4.29), 04_Conectores (R11.1)
SPI_FOC_SCK: 02_MCU (U4.27), 04_Conectores (R10.1)
SPI_IMU_CS: 02_MCU (U4.12), 03_Sensores (U5.12)
SPI_IMU_MISO: 02_MCU (U4.14), 03_Sensores (U5.1)
SPI_IMU_MOSI: 02_MCU (U4.15), 03_Sensores (U5.14)
SPI_IMU_SCK: 02_MCU (U4.13), 03_Sensores (U5.13)
SPI_SUP_MISO: 02_MCU (U4.41), 04_Conectores (J1.7)
SPI_SUP_MOSI: 02_MCU (U4.42), 04_Conectores (J1.6)
SPI_SUP_NSS: 02_MCU (U4.39), 04_Conectores (J1.8)
SPI_SUP_SCK: 02_MCU (U4.40), 04_Conectores (J1.5)
SUP_IRQ: 02_MCU (U4.32), 04_Conectores (J1.9)
SWCLK: 02_MCU (U4.38), 04_Conectores (J1.12 J2.2)
SWDIO: 02_MCU (U4.37), 04_Conectores (J1.11 J2.4)
UART_GNSS_RX: 02_MCU (U4.11), 03_Sensores (U6.2)
UART_GNSS_TX: 02_MCU (U4.10), 03_Sensores (U6.3)
VIN_12V: 01_Alimentacion (D1.2), 04_Conectores (J1.1 J1.2)
VIN_SENSE: 01_Alimentacion (C12.1 R1.1 R2.2), 02_MCU (U4.9)